# Altium schematic sheet EMGintegrated.SchDoc
size A; SheetNumber: 1; SheetTotal: 8
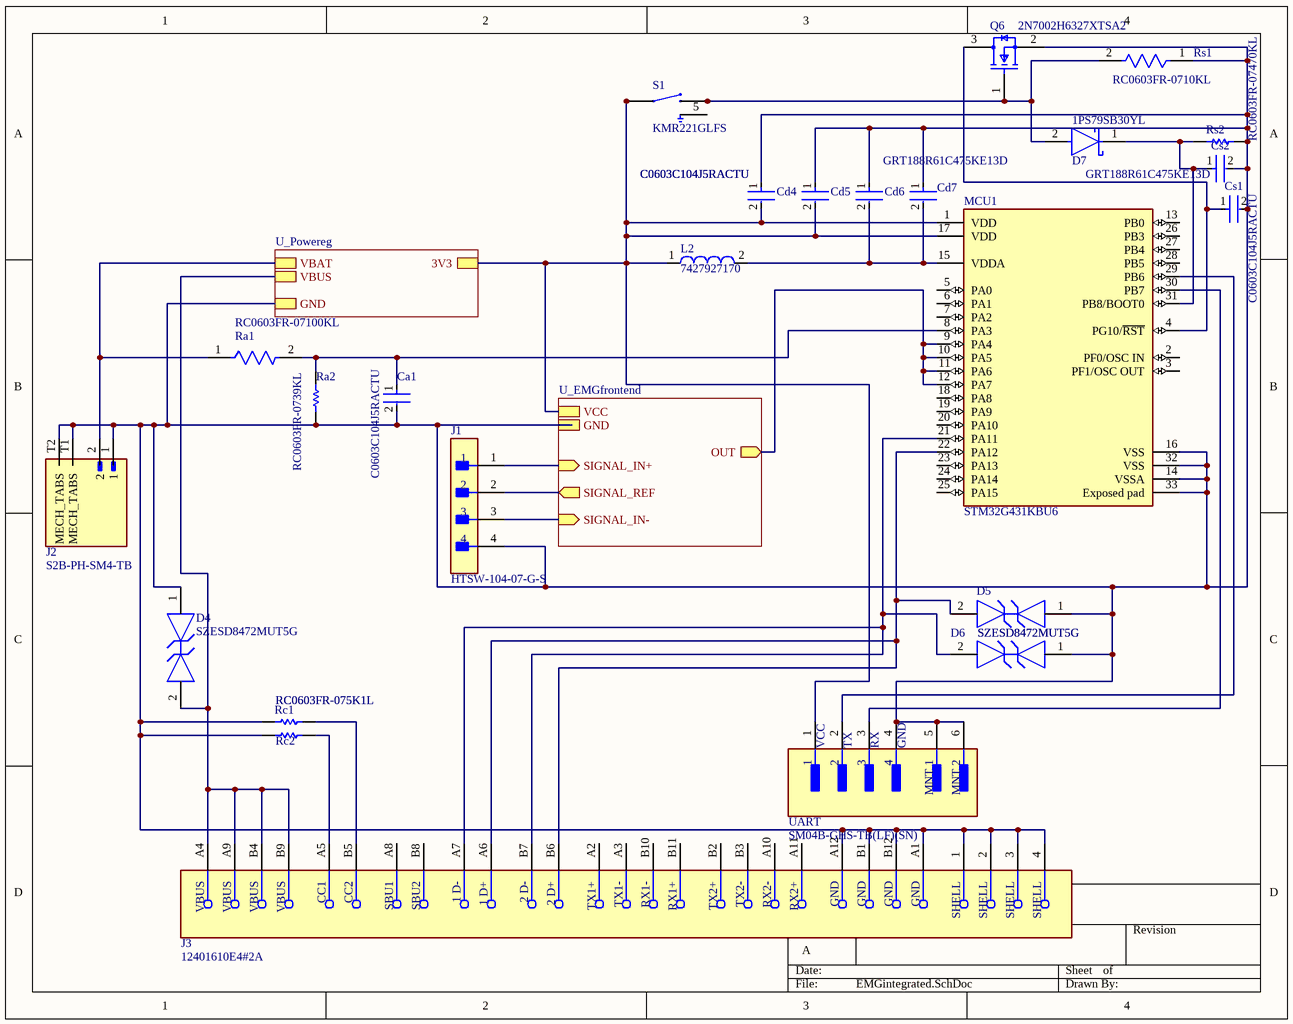
[diagram p0: EMGintegrated.SchDoc]

## Parts
Ca1  C0603C104J5RACTU  [FP-C0603C-CF-MFG]
Cd4  C0603C104J5RACTU  [FP-C0603C-CF-MFG]
Cd5  C0603C104J5RACTU  [FP-C0603C-CF-MFG]
Cd6  C0603C104J5RACTU  [FP-C0603C-CF-MFG]
Cd7  GRT188R61C475KE13D  [FP-GRT188-0_15-IPC_C]
Cs1  C0603C104J5RACTU  [FP-C0603C-CF-MFG]
Cs2  GRT188R61C475KE13D  [FP-GRT188-0_15-IPC_C]
D4  SZESD8472MUT5G  [FP-152AF-MFG]
D5  SZESD8472MUT5G  [FP-152AF-MFG]
D6  SZESD8472MUT5G  [FP-152AF-MFG]
D7  1PS79SB30YL  [FP-SOD523-MFG]
J1  HTSW-104-07-G-S  [FP-HTSW-104-07-G-S-MFG]
J2  S2B-PH-SM4-TB  [JST_S2B-PH-SM4-TB]
J3  12401610E4#2A  [FP-12401610E4#2A-MFG]
L2  7427927170  [SMD-0402]
MCU1  STM32G431KBU6  [FP-UFQFPN32-A0B8-IPC_A]
Q6  2N7002H6327XTSA2  [FP-PG-SOT23-3-MFG]
Ra1  RC0603FR-07100KL  [FP-RC0603-0_55-MFG]
Ra2  RC0603FR-0739KL  [RESC1608X55X25LL10T15]
Rc1  RC0603FR-075K1L  [RESC1608X55X25ML10T15]
Rc2  RC0603FR-075K1L  [RESC1608X55X25ML10T15]
Rs1  RC0603FR-0710KL  [FP-RC0603-0_55-IPC_C]
Rs2  RC0603FR-07470KL  [RESC1608X55X25ML10T15]
S1  KMR221GLFS  [SW_KMR221GLFS]
UART  SM04B-GHS-TB(LF)(SN)  [FP-SM04B-GHS-TB_LF_SN-MFG]

## Sub-sheets
U_EMGfrontend = EMGfrontend.SchDoc: OUT (out), VCC, GND, SIGNAL_IN+ (in), SIGNAL_REF (out), SIGNAL_IN- (in)
U_Powereg = Powereg.SchDoc: VBAT, 3V3, GND, VBUS

## Nets
NetCa1_1: Ca1.1 MCU1.8(PA3) Ra1.2 Ra2.2
NetCa1_2: Ca1.2 Cd4.1 Cd5.1 Cd6.1 Cd7.1 Cs1.2 Cs2.2 D4.1 D5.1 D6.1 J1.4 J2.1 J2.T1(MECH_TABS) J2.T2(MECH_TABS) J3.1(SHELL) J3.2(SHELL) J3.3(SHELL) J3.4(SHELL) J3.A1(GND) J3.A12(GND) J3.B1(GND) J3.B12(GND) MCU1.14(VSSA) MCU1.16(VSS) MCU1.32(VSS) MCU1.33(Exposed_pad) Q6.2(source) Ra2.1 Rc1.1 Rc2.1 Rs1.1 Rs2.2 UART.4 UART.5(MNT_1) UART.6(MNT_2) ; sheet U_EMGfrontend/GND, sheet U_Powereg/GND
NetCd4_2: Cd4.2 Cd5.2 L2.1 MCU1.1(VDD) MCU1.17(VDD) S1.1 S1.4 UART.1 ; sheet U_EMGfrontend/VCC, sheet U_Powereg/3V3
NetCd6_2: Cd6.2 Cd7.2 L2.2 MCU1.15(VDDA)
NetCs1_1: Cs1.1 MCU1.4(PG10/~{RST}) Q6.3(drain)
NetCs2_1: Cs2.1 D7.1(C) MCU1.31(PB8/BOOT0) Rs2.1
NetD4_2: D4.2 J3.A4(VBUS) J3.A9(VBUS) J3.B4(VBUS) J3.B9(VBUS) ; sheet U_Powereg/VBUS
NetD5_2: D5.2 J3.A6(1_D+) J3.B6(2_D+) MCU1.22(PA12)
NetD6_2: D6.2 J3.A7(1_D-) J3.B7(2_D-) MCU1.21(PA11)
NetD7_2: D7.2(A) Q6.1(gate) Rs1.2 S1.2 S1.3
NetJ1_1: J1.1 ; sheet U_EMGfrontend/SIGNAL_IN+
NetJ1_2: J1.2 ; sheet U_EMGfrontend/SIGNAL_REF
NetJ1_3: J1.3 ; sheet U_EMGfrontend/SIGNAL_IN-
NetJ2_2: J2.2 Ra1.1 ; sheet U_Powereg/VBAT
NetJ3_A5: J3.A5(CC1) Rc2.2
NetJ3_B5: J3.B5(CC2) Rc1.2
NetMCU1_9: MCU1.9(PA4) MCU1.10(PA5) MCU1.11(PA6) MCU1.12(PA7) ; sheet U_EMGfrontend/OUT
NetMCU1_29: MCU1.29(PB6) UART.2
NetMCU1_30: MCU1.30(PB7) UART.3

Not connected (* = marked no-connect by the designer): J3 A2(TX1+) A3(TX1-) A8(SBU1) A10(RX2-) A11(RX2+) B2(TX2+) B3(TX2-) B8(SBU2) B10(RX1-) B11(RX1+); MCU1 2(PF0/OSC_IN) 3(PF1/OSC_OUT) 5(PA0) 6(PA1) 7(PA2) 13(PB0) 18(PA8) 19(PA9) 20(PA10) 23(PA13) 24(PA14) 25(PA15) 26(PB3) 27(PB4) 28(PB5); S1 5

## Notes on the sheet
- (near UART) VCC
- (near UART) TX
- (near UART) RX
- (near UART) GND

## Library data of the parts
Ca1 Cd4-Cd6 Cs1 = CMP-2006-03056-2: CAP CER 0.1UF 50V 5% X7R 0603; Manufacturer: KEMET; Automotive Grade: Grade 1; Tolerance: 0.05; Capacitance: 0.10 μF; Value: 0.10 μF; Temperature Coefficient: 30ppm/°C; ComponentLink2Description: Datasheet; Voltage Rating: 50 V; Digikey Description: CAP CER 0.1UF 50V 5% X7R 0603; Manufacturer Part Number: C0603C104J5RACTU; Temperature Range High: +125°C; Device Class L2: Capacitors; Octopart: https://octopart.com/c0603c104j5ractu-kemet-10440638; RoHS: TRUE; Mouser Description: Multilayer Ceramic Capacitors MLCC - SMD/SMT 50volts 0.1uF X7R 5%; Temperature Range Low: -55°C; Automotive: Yes; Lead Free: Yes; ComponentLink2URL: https://api.kemet.com/component-edge/download/datasheet/C0603C100J5GACAUTO.pdf; Material: Ceramic; Device Class L3: Ceramic Capacitors; Package: C0603C-CF; Category: Cap; Temperature: -55°C to +125°C; Height: 0.87mm; Temperature Characteristic: X7R; Device Class L1: Passive Components
Cd7 Cs2 = CMP-06035-009119-1: Multi-Layer Ceramic Capacitor 4.7uF 16V X5R ±10% 0603 Paper T/R; Mount: Surface Mount; Width: 0.031inch; Case Code (Imperial): 0603; Capacitance: 4.7uF; Thickness: 0.035inch; Packaging: Cut Tape; Min Operating Temperature: -55°C; Case Code (Metric): 1608; Case/Package: 0603; Tolerance: 10%; Length: 0.063inch; Ratings: AEC-Q200; Max Operating Temperature: 85°C; Voltage Rating: 16V
D4-D6 = CMP-07200-000010-1: TVS DIODE 5.3V 14V 2X3DFN; Number of Bidirectional Channels: 1; Element Configuration: Single; Capacitance: 0.3pF; Peak Pulse Current: 3A; Power Line Protection: No; Min Breakdown Voltage: 7V; Direction: Bidirectional; Case/Package: DFN; Lead Free: Lead Free; Reverse Standoff Voltage: 5.3V; Clamping Voltage: 14V; Resistor Type: Zener; Packaging: Tape and Reel; Mount: Surface Mount; Number of Pins: 2; Max Operating Temperature: 150°C; Min Operating Temperature: -55°C; Working Voltage: 5.3V; RoHS Compliant: Yes
D7 = CMP-14398-000044-1: Schottky Diode, Single, 150Deg C, Sod523 Rohs Compliant: Yes
J1 = CMP-02766-001776-1: CONN HEADER VERT 4POS 2.54MM; Gender: Male; Number of Contacts: 4; Packaging: Bulk; RoHS Compliant: Yes; Number of Rows: 1; Mount: Through Hole; Contact Material: Bronze; Series: HTSW; Radiation Hardening: No; Pitch: 2.54mm; Reach SVHC Compliant: Yes; Contact Plating: Gold; Termination: Through Hole
J2 = S2B-PH-SM4-TB: MANUFACTURER: JST Sales; UNIT: MM; MAXIMUM_PACKAGE_HEIGHT: 5.5mm; MPN: S2B-PH-SM4-TB; STANDARD: Manufacturer Recommendations; Value: *
J3 = CMP-02355-000003-1: CONN RCP USB3.1 TYPEC 24P SMD RA; Connector Type: USB; Number of Contacts: 24; Gender: Receptacle; Packaging: Cut Tape; Mount: Surface Mount; Number of Pins: 24
L2 = CMP-0220-00142-1: SMD EMI Suppression Ferrite Bead WE-CBF, Z = 75 Ohm; Impedance: 75 Ohm; ComponentLink2Description: Datasheet; ComponentLink2URL: http://www.we-online.de/katalog/media/pdf/7427927170.pdf; ComponentLink1URL: http://www.we-online.com; PackageVersion: 2009; ComponentLink1Description: Manufacturer Link; PackageReference: SMD-0402; PackageDescription: Chip Inductor, 2-Leads, Body 1.0 x 0.5 mm; DatasheetVersion: ver 1, Jul-2009
MCU1 = CMP-12105-000119-1: IC MCU 32BIT 128KB FLSH 32UFQFPN; RoHS Compliant: Yes
Q6 = CMP-32901-000180-1: MOSFET N-CH 60V 0.3A SOT23; Rise Time: 3.3ns; Input Capacitance: 20pF; Rds On Max: 3R; Gate to Source Voltage (Vgs): 20V; Continuous Drain Current (ID): 300mA; Max Power Dissipation: 500mW; Packaging: Tape and Reel; Mount: Surface Mount; Case/Package: SOT-23; Drain to Source Voltage (Vdss): 60V; Min Operating Temperature: -55°C; Halogen Free: Halogen Free; Max Dual Supply Voltage: 60V; Number of Pins: 3; Lead Free: Lead Free; Max Operating Temperature: 150°C
Ra1 = CMP-2100-03662-2: RES SMD 100K OHM 1% 1/10W 0603; Voltage Rating (DC): 50V; Resistance: 100kR; Max Power Dissipation: 100mW; Temperature Coefficient: 100ppm/°C; Working Voltage: 75V; Length: 1.6mm; Lead Free: Lead Free; Number of Terminations: 2; Packaging: Tape and Reel; Voltage Rating: 50V; Termination: SMD/SMT; Width: 0.8mm; Resistor Type: Thick Film; Resistance Tolerance: 1%; Features: Moisture Resistant; Height: 0.45mm; Construction: Rectangular; Case/Package: 0603; Military Standard: Not; Case Code (Imperial): 0603; Series: RC; Technology: THICK FILM; Depth: 0.8mm; RoHS Compliant: Yes; REACH SVHC: No SVHC; Min Operating Temperature: -55°C; Case Code (Metric): 1608; Max Operating Temperature: 155°C; Power Rating: 100mW; Number of Pins: 2; Tolerance: 1%
Ra2 = CMP-2000-06940-1: Chip Resistor, 39 KOhm, +/- 1%, 0.1 W, -55 to 155 degC, 0603 (1608 Metric), RoHS, Tape and Reel; Manufacturer: Yageo; Resistance: 39kOhms; Voltage Rating: 50V; Power Rating: 100mW; Temperature Coefficient: 100PPM/C; Product: ThickFilmResistorsGeneralPurpose; Case Code - in: 0603; Tolerance: 1%; Operating Temperature Range: -55Cto+155C; Series: RC; Package Description: 2-Pin Surface Mount Device, Body 1.6 x 0.8 mm; Datasheet URL: http://www.yageo.com/documents/recent/PYu-RC_Group_51_RoHS_L_7.pdf; Package Reference: 0603; Case Code - mm: 1608; Datasheet Version: Rev. 7, 05/2017; Mounting Technology: SurfaceMount; Packaging: Reel; Manufacturer URL: http://www.yageo.com/; Termination Style: SMD/SMT
Rc1 Rc2 = CMP-2000-04091-1: Manufacturer: Yageo; Part Number: RC0603FR-075K1L
Rs1 = CMP-2100-03664-2: RES 10K OHM 1% 1/10W 0603; Voltage Rating: 75V; Voltage Rating (DC): 50V; Resistance: 10kR; Power Rating: 100mW; Temperature Coefficient: 100ppm/°C; Depth: 0.8mm; Termination: SMD/SMT; Resistor Type: Thick Film; Series: RC; Construction: Rectangular; Features: Moisture Resistant; Packaging: Tape and Reel; Min Operating Temperature: -55°C; Number of Terminations: 2; Lead Pitch: 0.3mm; RoHS Compliant: Yes; Case/Package: 0603; Resistance Tolerance: 1%; Military Standard: Not; Weight: 7.1E-05oz; Number of Pins: 2; Tolerance: 1%; Length: 1.6mm; Case Code (Imperial): 0603; Lead Free: Lead Free; Width: 0.8mm; Max Power Dissipation: 100mW; Height: 0.45mm; Max Operating Temperature: 155°C; Case Code (Metric): 1608; Size Code: 0603
Rs2 = CMP-1659-00049-1: Chip Resistor, 470 KOhm, +/- 1%, 0.1 W, -55 to 155 degC, 0603 (1608 Metric), RoHS, Tape and Reel; ComponentLink1Description: Manufacturer URL; ComponentLink2Description: Datasheet; ComponentLink2URL: http://www.yageo.com/documents/recent/PYu-RC_Group_51_RoHS_L_04.pdf; PackageReference: 0603; DatasheetVersion: Rev. 4, 02/2016; ComponentLink1URL: http://www.yageo.com/; PackageDescription: 2-Pin Surface Mount Device, Body 1.6 x 0.8 mm
S1 = KMR221GLFS: Switch Tactile N.O. SPST Button Gull Wing 0.05A 32VDC 1VA 200000Cycles 2N SMD Automotive T/R; MF: CK; SnapEDA_Link: https://www.snapeda.com/parts/KMR221G%20LFS/C%2526K/view-part/?ref=snap; Package: None; Value: *; MP: KMR221G LFS; Check_prices: https://www.snapeda.com/parts/KMR221G%20LFS/C%2526K/view-part/?ref=eda
UART = CMP-17439-000411-1: CONN HEADER SMD R/A 4POS 1.25MM; Voltage Rating: 50V; Number of Contacts: 4; Current Rating: 1A; Termination: Solder; Mount: Surface Mount; REACH SVHC: No SVHC; Packaging: Cut Tape; Contact Material: Bronze; Series: GH; Orientation: Right Angle; Lead Free: Lead Free; Housing Material: Nylon; Contact Plating: Tin; Housing Color: Natural; Number of Rows: 1; Pitch: 1.25mm; Number of Positions: 4